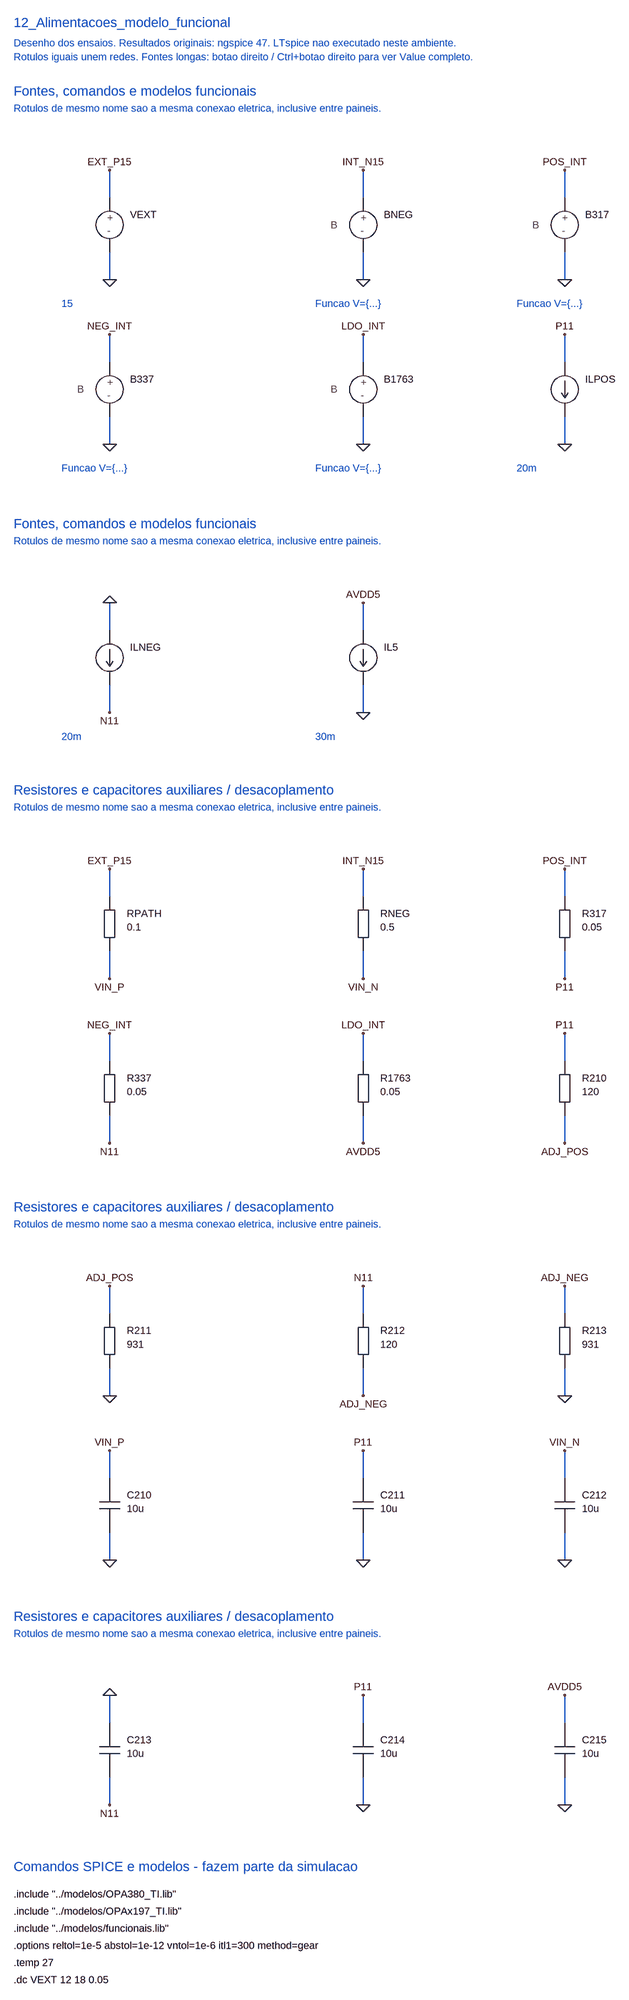
[diagram p0: schematic 12_Alimentacoes_modelo_funcional.asc]
12_Alimentacoes_modelo_funcional.asc, the LTspice schematic file:
Version 4.1
SHEET 1 1968 5584
TEXT 64 32 Left 3 ;12_Alimentacoes_modelo_funcional
TEXT 64 80 Left 2 ;Desenho dos ensaios. Resultados originais: ngspice 47. LTspice nao executado neste ambiente.
TEXT 64 112 Left 2 ;Rotulos iguais unem redes. Fontes longas: botao direito / Ctrl+botao direito para ver Value completo.
TEXT 64 192 Left 3 ;Fontes, comandos e modelos funcionais
TEXT 64 232 Left 2 ;Rotulos de mesmo nome sao a mesma conexao eletrica, inclusive entre paineis.
WIRE 288 512 288 448
WIRE 288 640 288 704
WIRE 880 512 880 448
WIRE 880 640 880 704
WIRE 1472 512 1472 448
WIRE 1472 640 1472 704
WIRE 288 896 288 832
WIRE 288 1024 288 1088
WIRE 880 896 880 832
WIRE 880 1024 880 1088
WIRE 1472 896 1472 832
WIRE 1472 1024 1472 1088
FLAG 288 448 EXT_P15
FLAG 288 704 0
FLAG 880 448 INT_N15
FLAG 880 704 0
FLAG 1472 448 POS_INT
FLAG 1472 704 0
FLAG 288 832 NEG_INT
FLAG 288 1088 0
FLAG 880 832 LDO_INT
FLAG 880 1088 0
FLAG 1472 832 P11
FLAG 1472 1088 0
SYMBOL CV_V 288 512 R0
SYMATTR InstName VEXT
SYMATTR Value 15
SYMBOL CV_B 880 512 R0
SYMATTR InstName BNEG
SYMATTR Value V={-15*min(max(V(VIN_P)/9,0),1)}
SYMBOL CV_B 1472 512 R0
SYMATTR InstName B317
SYMATTR Value V={min(max(V(VIN_P)-2,0),max(1.25+V(ADJ_POS),0))}
SYMBOL CV_B 288 896 R0
SYMATTR InstName B337
SYMATTR Value V={max(min(V(VIN_N)+2,0),min(V(ADJ_NEG)-1.25,0))}
SYMBOL CV_B 880 896 R0
SYMATTR InstName B1763
SYMATTR Value V={min(max(V(P11)-0.3,0),5)}
SYMBOL CV_I 1472 896 R0
SYMATTR InstName ILPOS
SYMATTR Value 20m
TEXT 176 760 Left 2 ;15
TEXT 768 760 Left 2 ;Funcao V={...}
TEXT 1360 760 Left 2 ;Funcao V={...}
TEXT 176 1144 Left 2 ;Funcao V={...}
TEXT 768 1144 Left 2 ;Funcao V={...}
TEXT 1360 1144 Left 2 ;20m
TEXT 64 1344 Left 3 ;Fontes, comandos e modelos funcionais
TEXT 64 1384 Left 2 ;Rotulos de mesmo nome sao a mesma conexao eletrica, inclusive entre paineis.
WIRE 288 1664 288 1600
WIRE 288 1792 288 1856
WIRE 880 1664 880 1600
WIRE 880 1792 880 1856
FLAG 288 1600 0
FLAG 288 1856 N11
FLAG 880 1600 AVDD5
FLAG 880 1856 0
SYMBOL CV_I 288 1664 R0
SYMATTR InstName ILNEG
SYMATTR Value 20m
SYMBOL CV_I 880 1664 R0
SYMATTR InstName IL5
SYMATTR Value 30m
TEXT 176 1912 Left 2 ;20m
TEXT 768 1912 Left 2 ;30m
TEXT 64 2112 Left 3 ;Resistores e capacitores auxiliares / desacoplamento
TEXT 64 2152 Left 2 ;Rotulos de mesmo nome sao a mesma conexao eletrica, inclusive entre paineis.
WIRE 288 2432 288 2368
WIRE 288 2560 288 2624
WIRE 880 2432 880 2368
WIRE 880 2560 880 2624
WIRE 1472 2432 1472 2368
WIRE 1472 2560 1472 2624
WIRE 288 2816 288 2752
WIRE 288 2944 288 3008
WIRE 880 2816 880 2752
WIRE 880 2944 880 3008
WIRE 1472 2816 1472 2752
WIRE 1472 2944 1472 3008
FLAG 288 2368 EXT_P15
FLAG 288 2624 VIN_P
FLAG 880 2368 INT_N15
FLAG 880 2624 VIN_N
FLAG 1472 2368 POS_INT
FLAG 1472 2624 P11
FLAG 288 2752 NEG_INT
FLAG 288 3008 N11
FLAG 880 2752 LDO_INT
FLAG 880 3008 AVDD5
FLAG 1472 2752 P11
FLAG 1472 3008 ADJ_POS
SYMBOL CV_RV 288 2432 R0
SYMATTR InstName RPATH
SYMATTR Value 0.1
SYMBOL CV_RV 880 2432 R0
SYMATTR InstName RNEG
SYMATTR Value 0.5
SYMBOL CV_RV 1472 2432 R0
SYMATTR InstName R317
SYMATTR Value 0.05
SYMBOL CV_RV 288 2816 R0
SYMATTR InstName R337
SYMATTR Value 0.05
SYMBOL CV_RV 880 2816 R0
SYMATTR InstName R1763
SYMATTR Value 0.05
SYMBOL CV_RV 1472 2816 R0
SYMATTR InstName R210
SYMATTR Value 120
TEXT 64 3264 Left 3 ;Resistores e capacitores auxiliares / desacoplamento
TEXT 64 3304 Left 2 ;Rotulos de mesmo nome sao a mesma conexao eletrica, inclusive entre paineis.
WIRE 288 3584 288 3520
WIRE 288 3712 288 3776
WIRE 880 3584 880 3520
WIRE 880 3712 880 3776
WIRE 1472 3584 1472 3520
WIRE 1472 3712 1472 3776
WIRE 288 3968 288 3904
WIRE 288 4096 288 4160
WIRE 880 3968 880 3904
WIRE 880 4096 880 4160
WIRE 1472 3968 1472 3904
WIRE 1472 4096 1472 4160
FLAG 288 3520 ADJ_POS
FLAG 288 3776 0
FLAG 880 3520 N11
FLAG 880 3776 ADJ_NEG
FLAG 1472 3520 ADJ_NEG
FLAG 1472 3776 0
FLAG 288 3904 VIN_P
FLAG 288 4160 0
FLAG 880 3904 P11
FLAG 880 4160 0
FLAG 1472 3904 VIN_N
FLAG 1472 4160 0
SYMBOL CV_RV 288 3584 R0
SYMATTR InstName R211
SYMATTR Value 931
SYMBOL CV_RV 880 3584 R0
SYMATTR InstName R212
SYMATTR Value 120
SYMBOL CV_RV 1472 3584 R0
SYMATTR InstName R213
SYMATTR Value 931
SYMBOL CV_CV 288 3968 R0
SYMATTR InstName C210
SYMATTR Value 10u
SYMBOL CV_CV 880 3968 R0
SYMATTR InstName C211
SYMATTR Value 10u
SYMBOL CV_CV 1472 3968 R0
SYMATTR InstName C212
SYMATTR Value 10u
TEXT 64 4416 Left 3 ;Resistores e capacitores auxiliares / desacoplamento
TEXT 64 4456 Left 2 ;Rotulos de mesmo nome sao a mesma conexao eletrica, inclusive entre paineis.
WIRE 288 4736 288 4672
WIRE 288 4864 288 4928
WIRE 880 4736 880 4672
WIRE 880 4864 880 4928
WIRE 1472 4736 1472 4672
WIRE 1472 4864 1472 4928
FLAG 288 4672 0
FLAG 288 4928 N11
FLAG 880 4672 P11
FLAG 880 4928 0
FLAG 1472 4672 AVDD5
FLAG 1472 4928 0
SYMBOL CV_CV 288 4736 R0
SYMATTR InstName C213
SYMATTR Value 10u
SYMBOL CV_CV 880 4736 R0
SYMATTR InstName C214
SYMATTR Value 10u
SYMBOL CV_CV 1472 4736 R0
SYMATTR InstName C215
SYMATTR Value 10u
TEXT 64 5184 Left 3 ;Comandos SPICE e modelos - fazem parte da simulacao
TEXT 64 5248 Left 2 !.include "../modelos/OPA380_TI.lib"
TEXT 64 5288 Left 2 !.include "../modelos/OPAx197_TI.lib"
TEXT 64 5328 Left 2 !.include "../modelos/funcionais.lib"
TEXT 64 5368 Left 2 !.options reltol=1e-5 abstol=1e-12 vntol=1e-6 itl1=300 method=gear
TEXT 64 5408 Left 2 !.temp 27
TEXT 64 5448 Left 2 !.dc VEXT 12 18 0.05

The netlist it stands for:
* 12_Alimentacoes_modelo_funcional.asc
VEXT EXT_P15 0 15
BNEG INT_N15 0 V={-15*min(max(V(VIN_P)/9,0),1)}
B317 POS_INT 0 V={min(max(V(VIN_P)-2,0),max(1.25+V(ADJ_POS),0))}
B337 NEG_INT 0 V={max(min(V(VIN_N)+2,0),min(V(ADJ_NEG)-1.25,0))}
B1763 LDO_INT 0 V={min(max(V(P11)-0.3,0),5)}
ILPOS P11 0 20m
ILNEG 0 N11 20m
IL5 AVDD5 0 30m
RPATH EXT_P15 VIN_P 0.1
RNEG INT_N15 VIN_N 0.5
R317 POS_INT P11 0.05
R337 NEG_INT N11 0.05
R1763 LDO_INT AVDD5 0.05
R210 P11 ADJ_POS 120
R211 ADJ_POS 0 931
R212 N11 ADJ_NEG 120
R213 ADJ_NEG 0 931
C210 VIN_P 0 10u
C211 P11 0 10u
C212 VIN_N 0 10u
C213 0 N11 10u
C214 P11 0 10u
C215 AVDD5 0 10u
* 12_Alimentacoes_modelo_funcional
* Desenho dos ensaios. Resultados originais: ngspice 47. LTspice nao executado neste ambiente.
* Rotulos iguais unem redes. Fontes longas: botao direito / Ctrl+botao direito para ver Value completo.
* Fontes, comandos e modelos funcionais
* Rotulos de mesmo nome sao a mesma conexao eletrica, inclusive entre paineis.
* 15
* Funcao V={...}
* Funcao V={...}
* Funcao V={...}
* Funcao V={...}
* 20m
* Fontes, comandos e modelos funcionais
* Rotulos de mesmo nome sao a mesma conexao eletrica, inclusive entre paineis.
* 20m
* 30m
* Resistores e capacitores auxiliares / desacoplamento
* Rotulos de mesmo nome sao a mesma conexao eletrica, inclusive entre paineis.
* Resistores e capacitores auxiliares / desacoplamento
* Rotulos de mesmo nome sao a mesma conexao eletrica, inclusive entre paineis.
* Resistores e capacitores auxiliares / desacoplamento
* Rotulos de mesmo nome sao a mesma conexao eletrica, inclusive entre paineis.
* Comandos SPICE e modelos - fazem parte da simulacao
.include "../modelos/OPA380_TI.lib"
.include "../modelos/OPAx197_TI.lib"
.include "../modelos/funcionais.lib"
.options reltol=1e-5 abstol=1e-12 vntol=1e-6 itl1=300 method=gear
.temp 27
.dc VEXT 12 18 0.05
.backanno
.end